# Altium schematic sheet Front Obstacle Brake.SchDoc
size A; SheetNumber: 7; SheetTotal: 7
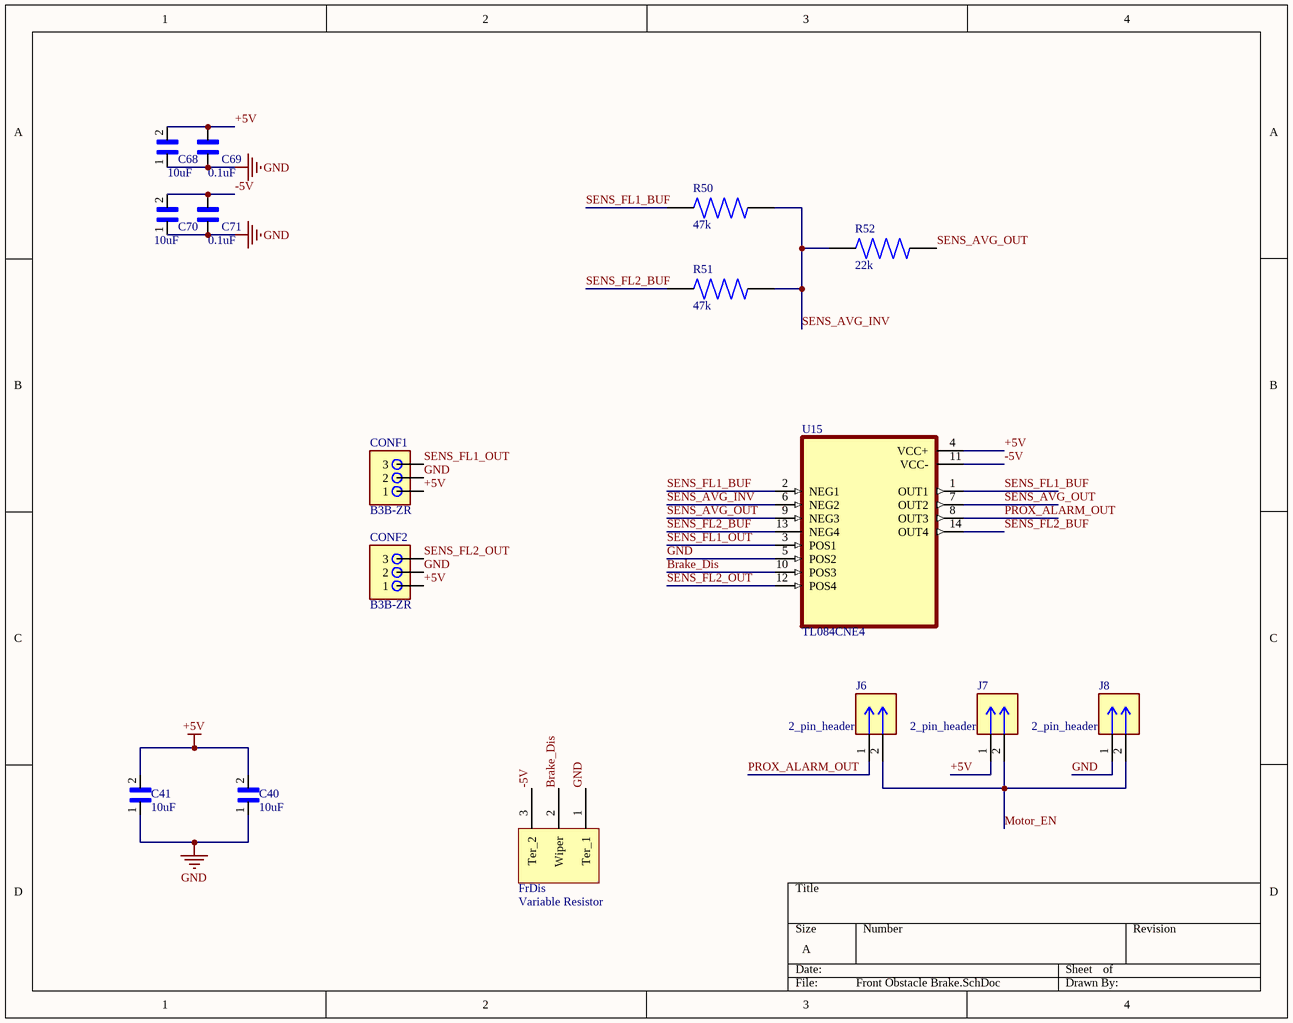
[diagram p0: Front Obstacle Brake.SchDoc]

## Parts
C40  10uF  [CAPC2012X145N]
C41  10uF  [CAPC2012X145N]
C68  10uF  [CAPC2012X145N]
C69  0.1uF  [CAPC2012X140N]
C70  10uF  [CAPC2012X145N]
C71  0.1uF  [CAPC2012X140N]
CONF1  B3B-ZR  [B3B-ZR]
CONF2  B3B-ZR  [B3B-ZR]
FrDis  Variable Resistor  [PCBComponent_1]
J6  2_pin_header  [CONN02_901200922_MOL]
J7  2_pin_header  [CONN02_901200922_MOL]
J8  2_pin_header  [CONN02_901200922_MOL]
R50  47k  [RESC2012X65N]
R51  47k  [RESC2012X65N]
R52  22k  [RESC2012X65N]
U15  TL084CNE4  [SOIC127P780X200-14N]

## Nets
+5V: C40.2 C41.2 C68.2 C69.1 CONF1.1 CONF2.1 J7.1 U15.4(VCC+)
GND: C40.1 C41.1 C68.1 C69.2 C70.1 C71.2 CONF1.2 CONF2.2 FrDis.1(Ter_1) J8.1 U15.5(POS2)
-5V: C70.2 C71.1 FrDis.3(Ter_2) U15.11(VCC-)
Brake_Dis: FrDis.2(Wiper) U15.10(POS3)
Motor_EN: J6.2 J7.2 J8.2
PROX_ALARM_OUT: J6.1 U15.8(OUT3)
SENS_AVG_INV: R50.2 R51.2 R52.1 U15.6(NEG2)
SENS_AVG_OUT: R52.2 U15.7(OUT2) U15.9(NEG3)
SENS_FL1_BUF: R50.1 U15.1(OUT1) U15.2(NEG1)
SENS_FL1_OUT: CONF1.3 U15.3(POS1)
SENS_FL2_BUF: R51.1 U15.13(NEG4) U15.14(OUT4)
SENS_FL2_OUT: CONF2.3 U15.12(POS4)

## Library data of the parts
C40 C41 C68 C70 = C2012X6S1C106K125AC: C Series 0805 10 uF 16 V Â±10 % Tolerance X6S SMT Multilayer Ceramic Capacitor; MF: TDK; MP: C2012X6S1C106K125AC; SnapEDA_Link: https://www.snapeda.com/parts/C2012X6S1C106K125AC/TDK-Lambda+Americas+Inc/view-part/?ref=snap; Check_prices: https://www.snapeda.com/parts/C2012X6S1C106K125AC/TDK-Lambda+Americas+Inc/view-part/?ref=eda; Value: *; Purchase-URL: https://pricing.snapeda.com/search/part/C2012X6S1C106K125AC/?ref=eda; Package: 2012 TDK
C69 C71 = FS055C104K4Z2A: 0.1 ÂµF Â±10% 50V Ceramic Capacitor X7R 0805 (2012 Metric); MF: AVX; SnapEDA_Link: https://www.snapeda.com/parts/FS055C104K4Z2A/AVX/view-part/?ref=snap; Package: 0805-2 AVX; Value: *; MP: FS055C104K4Z2A; Check_prices: https://www.snapeda.com/parts/FS055C104K4Z2A/AVX/view-part/?ref=eda
CONF1 CONF2 = B3B-ZR: Connector Header Surface Mount 3 position 0.059 (1.50mm); MF: JST Sales; SnapEDA_Link: https://www.snapeda.com/parts/B3B-ZR/JST+Sales+America+Inc./view-part/?ref=snap; Package: None; Value: *; MP: B3B-ZR; Check_prices: https://www.snapeda.com/parts/B3B-ZR/JST+Sales+America+Inc./view-part/?ref=eda
J6-J8 = 901200922: Package: None; Price: None; Value: *; MP: 901200922; Availability: Unavailable
R50 R51 = CRGCQ0805F47K: Fixed Resistor CRGCQ 0805 47K 1%; MF: TE Connectivity; SnapEDA_Link: https://www.snapeda.com/parts/CRGCQ0805F47K/TE+Connectivity/view-part/?ref=snap; Package: 2012 TE Connectivity; Value: *; MP: CRGCQ0805F47K; Check_prices: https://www.snapeda.com/parts/CRGCQ0805F47K/TE+Connectivity/view-part/?ref=eda
R52 = CRGCQ0805F22K: Fixed Resistor CRGCQ 0805 22K 1%; MF: TE Connectivity; SnapEDA_Link: https://www.snapeda.com/parts/CRGCQ0805F22K/TE+Connectivity/view-part/?ref=snap; Package: 2012 TE Connectivity; Value: *; MP: CRGCQ0805F22K; Check_prices: https://www.snapeda.com/parts/CRGCQ0805F22K/TE+Connectivity/view-part/?ref=eda
U15 = TL084CNE4: Quad High Slew Rate JFET-Input Operational Amplifier 14-PDIP 0 to 70; MF: Texas Instruments; SnapEDA_Link: https://www.snapeda.com/parts/TL084CNE4/Texas+Instruments/view-part/?ref=snap; Package: PDIP-14 Texas Instruments; Value: *; MP: TL084CNE4; Check_prices: https://www.snapeda.com/parts/TL084CNE4/Texas+Instruments/view-part/?ref=eda